# Altium schematic sheet STPMotorConnections.SchDoc
size A4; SheetNumber: 1; SheetTotal: 8
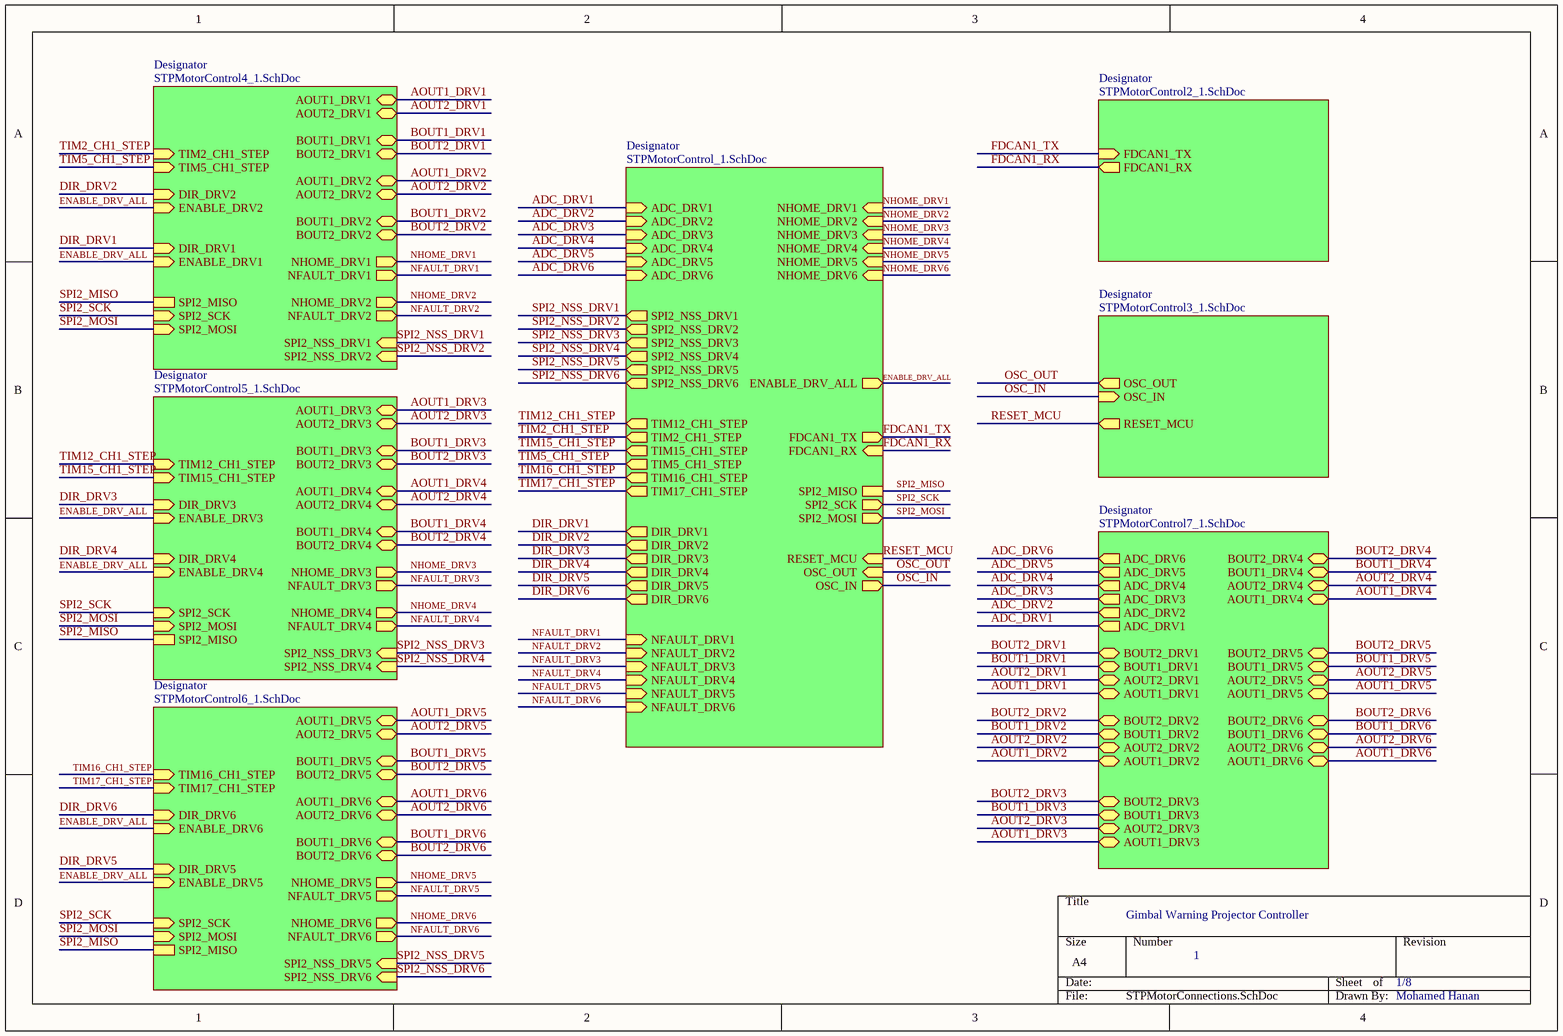
[diagram p0: STPMotorConnections.SchDoc]

## Sub-sheets
Designator = STPMotorControl_1.SchDoc: TIM12_CH1_STEP (out), TIM2_CH1_STEP (out), TIM15_CH1_STEP (out), TIM5_CH1_STEP (out), TIM16_CH1_STEP (out), TIM17_CH1_STEP (out), DIR_DRV1 (out), DIR_DRV2 (out), DIR_DRV3 (out), DIR_DRV4 (out), DIR_DRV5 (out), DIR_DRV6 (out), NFAULT_DRV1 (in), NFAULT_DRV2 (in), NFAULT_DRV3 (in), NFAULT_DRV4 (in), NFAULT_DRV5 (in), NFAULT_DRV6 (in), NHOME_DRV1 (in), NHOME_DRV2 (in), NHOME_DRV3 (in), NHOME_DRV4 (in), NHOME_DRV5 (in), NHOME_DRV6 (in), ENABLE_DRV_ALL (out), FDCAN1_TX (out), FDCAN1_RX (in), SPI2_MISO, SPI2_SCK (out), SPI2_MOSI (out), RESET_MCU (in), OSC_OUT (in), OSC_IN (out), ADC_DRV1 (in), ADC_DRV2 (in), ADC_DRV3 (in), ADC_DRV4 (in), ADC_DRV5 (in), ADC_DRV6 (in), SPI2_NSS_DRV1 (out), SPI2_NSS_DRV2 (out), SPI2_NSS_DRV3 (out), SPI2_NSS_DRV4 (out), SPI2_NSS_DRV5 (out), SPI2_NSS_DRV6 (out)
Designator = STPMotorControl2_1.SchDoc: FDCAN1_TX (in), FDCAN1_RX (out)
Designator = STPMotorControl3_1.SchDoc: OSC_OUT (out), OSC_IN (in), RESET_MCU (out)
Designator = STPMotorControl4_1.SchDoc: AOUT1_DRV1 (bidir), AOUT2_DRV1 (bidir), BOUT1_DRV1 (bidir), BOUT2_DRV1 (bidir), AOUT1_DRV2 (bidir), AOUT2_DRV2 (bidir), BOUT1_DRV2 (bidir), BOUT2_DRV2 (bidir), NHOME_DRV1 (out), NFAULT_DRV1 (out), SPI2_NSS_DRV2 (in), SPI2_MISO, SPI2_SCK (in), SPI2_MOSI (in), NHOME_DRV2 (out), NFAULT_DRV2 (out), DIR_DRV1 (in), ENABLE_DRV1 (in), DIR_DRV2 (in), ENABLE_DRV2 (in), TIM2_CH1_STEP (in), TIM5_CH1_STEP (in), SPI2_NSS_DRV1 (in)
Designator = STPMotorControl5_1.SchDoc: AOUT1_DRV3 (bidir), AOUT2_DRV3 (bidir), BOUT1_DRV3 (bidir), BOUT2_DRV3 (bidir), AOUT1_DRV4 (bidir), AOUT2_DRV4 (bidir), BOUT1_DRV4 (bidir), BOUT2_DRV4 (bidir), NHOME_DRV3 (out), NFAULT_DRV3 (out), NHOME_DRV4 (out), NFAULT_DRV4 (out), SPI2_NSS_DRV4 (in), SPI2_SCK (in), SPI2_MOSI (in), SPI2_MISO, DIR_DRV4 (in), ENABLE_DRV4 (in), TIM12_CH1_STEP (in), TIM15_CH1_STEP (in), DIR_DRV3 (in), ENABLE_DRV3 (in), SPI2_NSS_DRV3 (in)
Designator = STPMotorControl6_1.SchDoc: AOUT1_DRV5 (bidir), AOUT2_DRV5 (bidir), BOUT1_DRV5 (bidir), BOUT2_DRV5 (bidir), AOUT1_DRV6 (bidir), AOUT2_DRV6 (bidir), BOUT1_DRV6 (bidir), BOUT2_DRV6 (bidir), NHOME_DRV5 (out), NFAULT_DRV5 (out), NHOME_DRV6 (out), NFAULT_DRV6 (out), SPI2_NSS_DRV6 (in), SPI2_SCK (in), SPI2_MOSI (in), SPI2_MISO, DIR_DRV5 (in), ENABLE_DRV5 (in), DIR_DRV6 (in), ENABLE_DRV6 (in), TIM16_CH1_STEP (in), TIM17_CH1_STEP (in), SPI2_NSS_DRV5 (in)
Designator = STPMotorControl7_1.SchDoc: ADC_DRV6 (out), ADC_DRV5 (out), ADC_DRV4 (out), ADC_DRV3 (out), ADC_DRV2 (out), ADC_DRV1 (out), BOUT2_DRV1 (bidir), BOUT1_DRV1 (bidir), AOUT2_DRV1 (bidir), AOUT1_DRV1 (bidir), BOUT2_DRV2 (bidir), BOUT1_DRV2 (bidir), AOUT2_DRV2 (bidir), AOUT1_DRV2 (bidir), BOUT2_DRV3 (bidir), BOUT1_DRV3 (bidir), AOUT2_DRV3 (bidir), AOUT1_DRV3 (bidir), BOUT2_DRV4 (bidir), BOUT1_DRV4 (bidir), AOUT2_DRV4 (bidir), AOUT1_DRV4 (bidir), BOUT2_DRV5 (bidir), BOUT1_DRV5 (bidir), AOUT2_DRV5 (bidir), AOUT1_DRV5 (bidir), BOUT2_DRV6 (bidir), BOUT1_DRV6 (bidir), AOUT2_DRV6 (bidir), AOUT1_DRV6 (bidir)

## Nets
ADC_DRV1: sheet Designator/ADC_DRV1, sheet Designator/ADC_DRV1
ADC_DRV2: sheet Designator/ADC_DRV2, sheet Designator/ADC_DRV2
ADC_DRV3: sheet Designator/ADC_DRV3, sheet Designator/ADC_DRV3
ADC_DRV4: sheet Designator/ADC_DRV4, sheet Designator/ADC_DRV4
ADC_DRV5: sheet Designator/ADC_DRV5, sheet Designator/ADC_DRV5
ADC_DRV6: sheet Designator/ADC_DRV6, sheet Designator/ADC_DRV6
AOUT1_DRV1: sheet Designator/AOUT1_DRV1, sheet Designator/AOUT1_DRV1
AOUT1_DRV2: sheet Designator/AOUT1_DRV2, sheet Designator/AOUT1_DRV2
AOUT1_DRV3: sheet Designator/AOUT1_DRV3, sheet Designator/AOUT1_DRV3
AOUT1_DRV4: sheet Designator/AOUT1_DRV4, sheet Designator/AOUT1_DRV4
AOUT1_DRV5: sheet Designator/AOUT1_DRV5, sheet Designator/AOUT1_DRV5
AOUT1_DRV6: sheet Designator/AOUT1_DRV6, sheet Designator/AOUT1_DRV6
AOUT2_DRV1: sheet Designator/AOUT2_DRV1, sheet Designator/AOUT2_DRV1
AOUT2_DRV2: sheet Designator/AOUT2_DRV2, sheet Designator/AOUT2_DRV2
AOUT2_DRV3: sheet Designator/AOUT2_DRV3, sheet Designator/AOUT2_DRV3
AOUT2_DRV4: sheet Designator/AOUT2_DRV4, sheet Designator/AOUT2_DRV4
AOUT2_DRV5: sheet Designator/AOUT2_DRV5, sheet Designator/AOUT2_DRV5
AOUT2_DRV6: sheet Designator/AOUT2_DRV6, sheet Designator/AOUT2_DRV6
BOUT1_DRV1: sheet Designator/BOUT1_DRV1, sheet Designator/BOUT1_DRV1
BOUT1_DRV2: sheet Designator/BOUT1_DRV2, sheet Designator/BOUT1_DRV2
BOUT1_DRV3: sheet Designator/BOUT1_DRV3, sheet Designator/BOUT1_DRV3
BOUT1_DRV4: sheet Designator/BOUT1_DRV4, sheet Designator/BOUT1_DRV4
BOUT1_DRV5: sheet Designator/BOUT1_DRV5, sheet Designator/BOUT1_DRV5
BOUT1_DRV6: sheet Designator/BOUT1_DRV6, sheet Designator/BOUT1_DRV6
BOUT2_DRV1: sheet Designator/BOUT2_DRV1, sheet Designator/BOUT2_DRV1
BOUT2_DRV2: sheet Designator/BOUT2_DRV2, sheet Designator/BOUT2_DRV2
BOUT2_DRV3: sheet Designator/BOUT2_DRV3, sheet Designator/BOUT2_DRV3
BOUT2_DRV4: sheet Designator/BOUT2_DRV4, sheet Designator/BOUT2_DRV4
BOUT2_DRV5: sheet Designator/BOUT2_DRV5, sheet Designator/BOUT2_DRV5
BOUT2_DRV6: sheet Designator/BOUT2_DRV6, sheet Designator/BOUT2_DRV6
DIR_DRV1: sheet Designator/DIR_DRV1, sheet Designator/DIR_DRV1
DIR_DRV2: sheet Designator/DIR_DRV2, sheet Designator/DIR_DRV2
DIR_DRV3: sheet Designator/DIR_DRV3, sheet Designator/DIR_DRV3
DIR_DRV4: sheet Designator/DIR_DRV4, sheet Designator/DIR_DRV4
DIR_DRV5: sheet Designator/DIR_DRV5, sheet Designator/DIR_DRV5
DIR_DRV6: sheet Designator/DIR_DRV6, sheet Designator/DIR_DRV6
ENABLE_DRV_ALL: sheet Designator/ENABLE_DRV_ALL, sheet Designator/ENABLE_DRV1, sheet Designator/ENABLE_DRV2, sheet Designator/ENABLE_DRV4, sheet Designator/ENABLE_DRV3, sheet Designator/ENABLE_DRV5, sheet Designator/ENABLE_DRV6
FDCAN1_RX: sheet Designator/FDCAN1_RX, sheet Designator/FDCAN1_RX
FDCAN1_TX: sheet Designator/FDCAN1_TX, sheet Designator/FDCAN1_TX
NFAULT_DRV1: sheet Designator/NFAULT_DRV1, sheet Designator/NFAULT_DRV1
NFAULT_DRV2: sheet Designator/NFAULT_DRV2, sheet Designator/NFAULT_DRV2
NFAULT_DRV3: sheet Designator/NFAULT_DRV3, sheet Designator/NFAULT_DRV3
NFAULT_DRV4: sheet Designator/NFAULT_DRV4, sheet Designator/NFAULT_DRV4
NFAULT_DRV5: sheet Designator/NFAULT_DRV5, sheet Designator/NFAULT_DRV5
NFAULT_DRV6: sheet Designator/NFAULT_DRV6, sheet Designator/NFAULT_DRV6
NHOME_DRV1: sheet Designator/NHOME_DRV1, sheet Designator/NHOME_DRV1
NHOME_DRV2: sheet Designator/NHOME_DRV2, sheet Designator/NHOME_DRV2
NHOME_DRV3: sheet Designator/NHOME_DRV3, sheet Designator/NHOME_DRV3
NHOME_DRV4: sheet Designator/NHOME_DRV4, sheet Designator/NHOME_DRV4
NHOME_DRV5: sheet Designator/NHOME_DRV5, sheet Designator/NHOME_DRV5
NHOME_DRV6: sheet Designator/NHOME_DRV6, sheet Designator/NHOME_DRV6
OSC_IN: sheet Designator/OSC_IN, sheet Designator/OSC_IN
OSC_OUT: sheet Designator/OSC_OUT, sheet Designator/OSC_OUT
RESET_MCU: sheet Designator/RESET_MCU, sheet Designator/RESET_MCU
SPI2_MISO: sheet Designator/SPI2_MISO, sheet Designator/SPI2_MISO, sheet Designator/SPI2_MISO, sheet Designator/SPI2_MISO
SPI2_MOSI: sheet Designator/SPI2_MOSI, sheet Designator/SPI2_MOSI, sheet Designator/SPI2_MOSI, sheet Designator/SPI2_MOSI
SPI2_NSS_DRV1: sheet Designator/SPI2_NSS_DRV1, sheet Designator/SPI2_NSS_DRV1
SPI2_NSS_DRV2: sheet Designator/SPI2_NSS_DRV2, sheet Designator/SPI2_NSS_DRV2
SPI2_NSS_DRV3: sheet Designator/SPI2_NSS_DRV3, sheet Designator/SPI2_NSS_DRV3
SPI2_NSS_DRV4: sheet Designator/SPI2_NSS_DRV4, sheet Designator/SPI2_NSS_DRV4
SPI2_NSS_DRV5: sheet Designator/SPI2_NSS_DRV5, sheet Designator/SPI2_NSS_DRV5
SPI2_NSS_DRV6: sheet Designator/SPI2_NSS_DRV6, sheet Designator/SPI2_NSS_DRV6
SPI2_SCK: sheet Designator/SPI2_SCK, sheet Designator/SPI2_SCK, sheet Designator/SPI2_SCK, sheet Designator/SPI2_SCK
TIM2_CH1_STEP: sheet Designator/TIM2_CH1_STEP, sheet Designator/TIM2_CH1_STEP
TIM5_CH1_STEP: sheet Designator/TIM5_CH1_STEP, sheet Designator/TIM5_CH1_STEP
TIM12_CH1_STEP: sheet Designator/TIM12_CH1_STEP, sheet Designator/TIM12_CH1_STEP
TIM15_CH1_STEP: sheet Designator/TIM15_CH1_STEP, sheet Designator/TIM15_CH1_STEP
TIM16_CH1_STEP: sheet Designator/TIM16_CH1_STEP, sheet Designator/TIM16_CH1_STEP
TIM17_CH1_STEP: sheet Designator/TIM17_CH1_STEP, sheet Designator/TIM17_CH1_STEP

## Notes on the sheet
- Gimbal Warning Projector Controller
- 1
- 1/8
- Mohamed Hanan